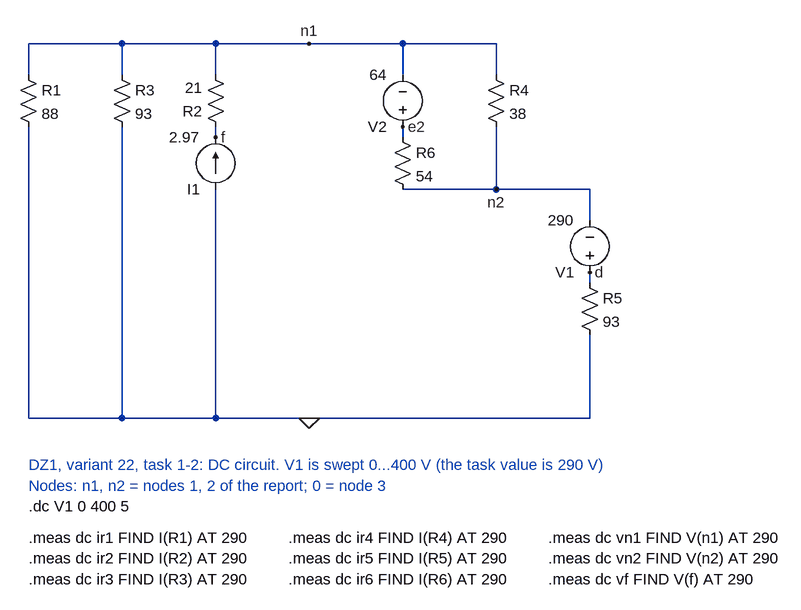
[diagram p0: schematic task12_dc_var22.asc]
task12_dc_var22.asc, the LTspice schematic file:
Version 4
SHEET 1 1300 1016
WIRE 192 128 192 176
WIRE 192 256 192 704
WIRE 336 128 336 176
WIRE 336 256 336 704
WIRE 480 128 480 176
WIRE 480 256 480 272
WIRE 480 352 480 704
WIRE 768 128 768 176
WIRE 768 256 768 272
WIRE 912 128 912 176
WIRE 912 256 912 352
WIRE 1056 352 1056 400
WIRE 1056 480 1056 496
WIRE 1056 576 1056 704
WIRE 192 128 336 128
WIRE 336 128 480 128
WIRE 480 128 624 128
WIRE 624 128 768 128
WIRE 768 128 912 128
WIRE 768 352 912 352
WIRE 912 352 1056 352
WIRE 192 704 336 704
WIRE 336 704 480 704
WIRE 480 704 624 704
WIRE 624 704 1056 704
FLAG 624 704 0
FLAG 624 128 n1
FLAG 912 352 n2
FLAG 768 256 e2
FLAG 1056 480 d
FLAG 480 272 f
SYMBOL res 176 160 R0
SYMATTR InstName R1
SYMATTR Value 88
SYMBOL res 320 160 R0
SYMATTR InstName R3
SYMATTR Value 93
SYMBOL res 496 272 R180
SYMATTR InstName R2
SYMATTR Value 21
SYMBOL current 480 352 R180
SYMATTR InstName I1
SYMATTR Value 2.97
SYMBOL voltage 768 272 R180
SYMATTR InstName V2
SYMATTR Value 64
SYMBOL res 752 256 R0
SYMATTR InstName R6
SYMATTR Value 54
SYMBOL res 896 160 R0
SYMATTR InstName R4
SYMATTR Value 38
SYMBOL voltage 1056 496 R180
SYMATTR InstName V1
SYMATTR Value 290
SYMBOL res 1040 480 R0
SYMATTR InstName R5
SYMATTR Value 93
TEXT 192 776 Left 2 ;DZ1, variant 22, task 1-2: DC circuit. V1 is swept 0...400 V (the task value is 290 V)
TEXT 192 808 Left 2 ;Nodes: n1, n2 = nodes 1, 2 of the report; 0 = node 3
TEXT 192 840 Left 2 !.dc V1 0 400 5
TEXT 192 888 Left 2 !.meas dc ir1 FIND I(R1) AT 290
TEXT 192 920 Left 2 !.meas dc ir2 FIND I(R2) AT 290
TEXT 192 952 Left 2 !.meas dc ir3 FIND I(R3) AT 290
TEXT 592 888 Left 2 !.meas dc ir4 FIND I(R4) AT 290
TEXT 592 920 Left 2 !.meas dc ir5 FIND I(R5) AT 290
TEXT 592 952 Left 2 !.meas dc ir6 FIND I(R6) AT 290
TEXT 992 888 Left 2 !.meas dc vn1 FIND V(n1) AT 290
TEXT 992 920 Left 2 !.meas dc vn2 FIND V(n2) AT 290
TEXT 992 952 Left 2 !.meas dc vf FIND V(f) AT 290

The netlist it stands for:
* task12_dc_var22.asc
R1 n1 0 88
R3 n1 0 93
R2 f n1 21
I1 0 f 2.97
V2 e2 n1 64
R6 e2 n2 54
R4 n1 n2 38
V1 d n2 290
R5 d 0 93
* DZ1, variant 22, task 1-2: DC circuit. V1 is swept 0...400 V (the task value is 290 V)
* Nodes: n1, n2 = nodes 1, 2 of the report; 0 = node 3
.dc V1 0 400 5
.meas dc ir1 FIND I(R1) AT 290
.meas dc ir2 FIND I(R2) AT 290
.meas dc ir3 FIND I(R3) AT 290
.meas dc ir4 FIND I(R4) AT 290
.meas dc ir5 FIND I(R5) AT 290
.meas dc ir6 FIND I(R6) AT 290
.meas dc vn1 FIND V(n1) AT 290
.meas dc vn2 FIND V(n2) AT 290
.meas dc vf FIND V(f) AT 290
.backanno
.end